# Altium schematic sheet netlist.SchDoc
size A; SheetNumber: 1; SheetTotal: 1
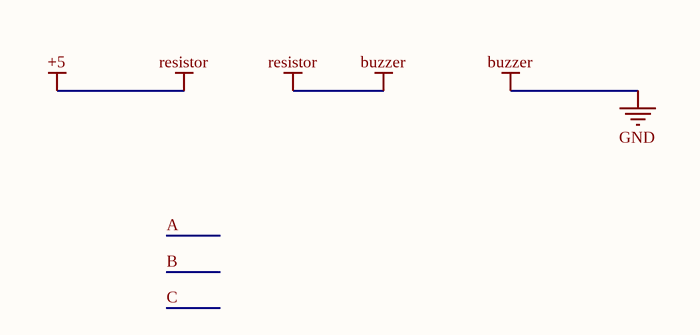
[diagram p0: netlist.SchDoc]